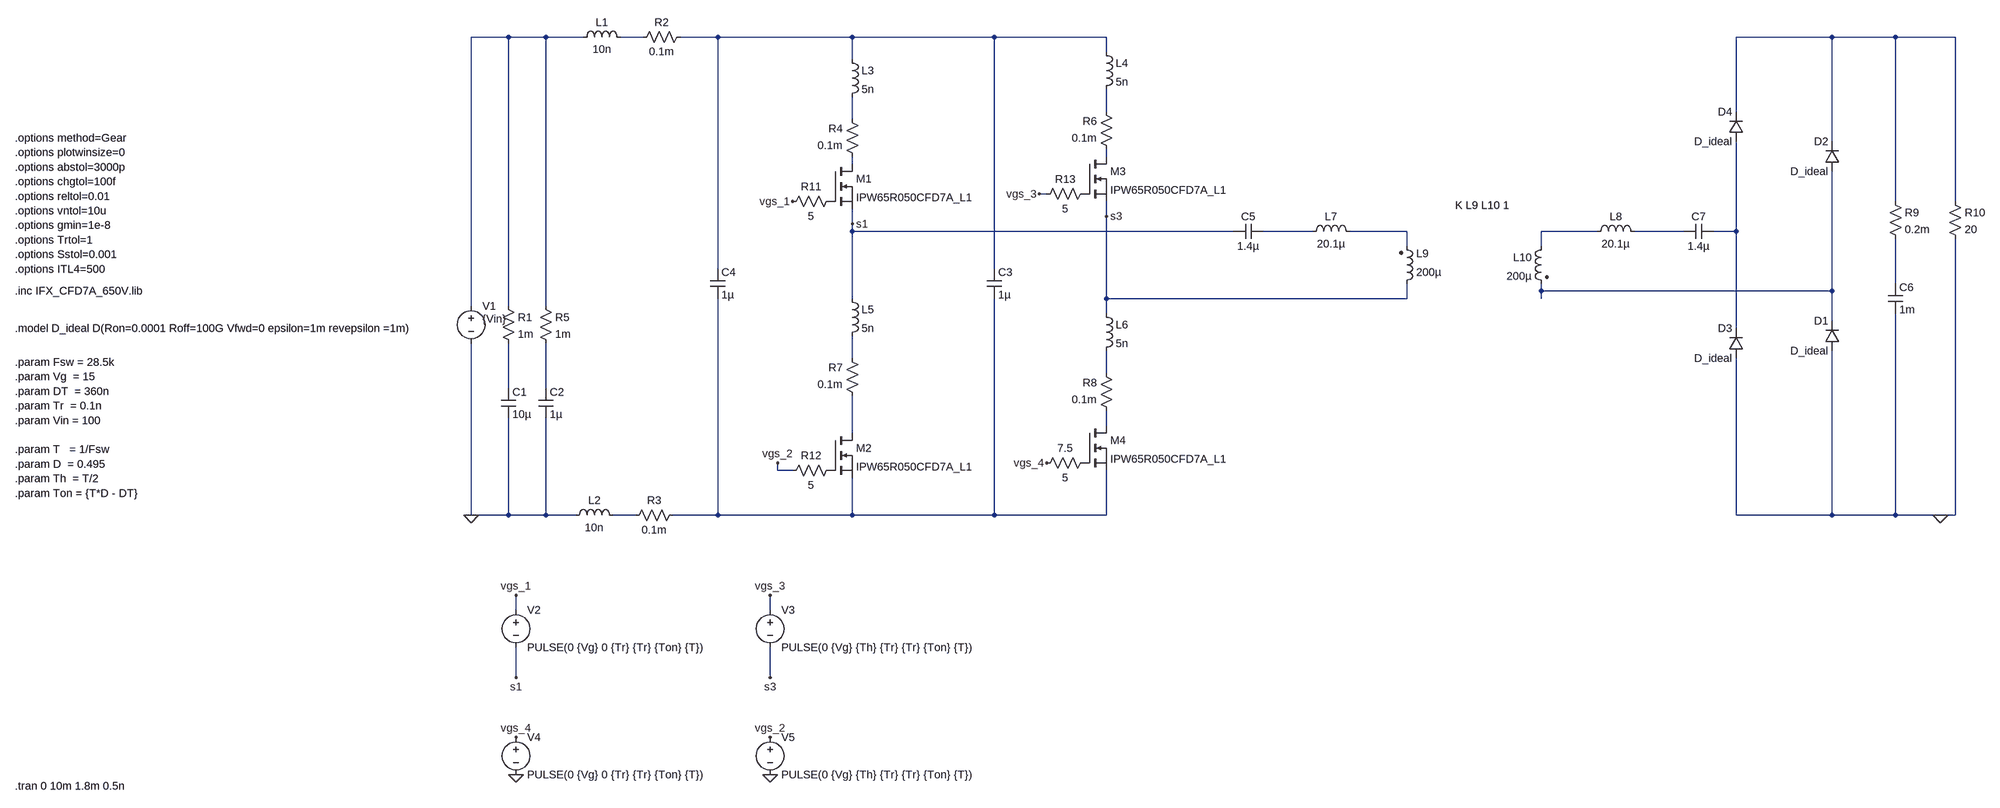
[diagram p0: schematic CLLC_v3.asc]
CLLC_v3.asc, the LTspice schematic file:
Version 4.1
SHEET 1 3956 1640
WIRE 464 -16 384 -16
WIRE 544 -16 464 -16
WIRE 624 -16 544 -16
WIRE 752 -16 704 -16
WIRE 912 -16 832 -16
WIRE 1200 -16 912 -16
WIRE 1504 -16 1200 -16
WIRE 1744 -16 1504 -16
WIRE 3456 -16 3152 -16
WIRE 3760 -16 3456 -16
WIRE 3888 -16 3760 -16
WIRE 1744 16 1744 -16
WIRE 1200 32 1200 -16
WIRE 1744 144 1744 96
WIRE 3152 144 3152 -16
WIRE 1200 160 1200 112
WIRE 3456 208 3456 -16
WIRE 1744 240 1744 224
WIRE 1200 256 1200 240
WIRE 1616 320 1600 320
WIRE 3760 336 3760 -16
WIRE 3888 336 3888 -16
WIRE 1744 368 1744 336
WIRE 1200 384 1200 352
WIRE 1200 400 1200 384
WIRE 2016 400 1200 400
WIRE 2192 400 2080 400
WIRE 2432 400 2272 400
WIRE 2848 400 2720 400
WIRE 3040 400 2928 400
WIRE 3152 400 3152 208
WIRE 3152 400 3104 400
WIRE 2432 432 2432 400
WIRE 2720 432 2720 400
WIRE 912 480 912 -16
WIRE 1504 480 1504 -16
WIRE 3760 512 3760 416
WIRE 2720 528 2720 512
WIRE 3456 528 3456 272
WIRE 3456 528 2720 528
WIRE 1200 544 1200 400
WIRE 1744 544 1744 368
WIRE 2432 544 2432 512
WIRE 2432 544 1744 544
WIRE 2720 544 2720 528
WIRE 384 560 384 -16
WIRE 464 560 464 -16
WIRE 544 560 544 -16
WIRE 1744 576 1744 544
WIRE 3456 592 3456 528
WIRE 3152 608 3152 400
WIRE 1200 672 1200 624
WIRE 1744 704 1744 656
WIRE 464 736 464 640
WIRE 544 736 544 640
WIRE 1744 816 1744 784
WIRE 1200 832 1200 752
WIRE 1040 912 1040 896
WIRE 1072 912 1040 912
WIRE 384 1008 384 640
WIRE 464 1008 464 800
WIRE 464 1008 384 1008
WIRE 544 1008 544 800
WIRE 544 1008 464 1008
WIRE 608 1008 544 1008
WIRE 736 1008 688 1008
WIRE 912 1008 912 544
WIRE 912 1008 816 1008
WIRE 1200 1008 1200 928
WIRE 1200 1008 912 1008
WIRE 1504 1008 1504 544
WIRE 1504 1008 1200 1008
WIRE 1744 1008 1744 912
WIRE 1744 1008 1504 1008
WIRE 3152 1008 3152 672
WIRE 3456 1008 3456 656
WIRE 3456 1008 3152 1008
WIRE 3760 1008 3760 576
WIRE 3760 1008 3456 1008
WIRE 3856 1008 3760 1008
WIRE 3888 1008 3888 416
WIRE 3888 1008 3856 1008
WIRE 480 1248 480 1216
WIRE 1024 1248 1024 1216
WIRE 480 1392 480 1328
WIRE 1024 1392 1024 1328
FLAG 384 1008 0
FLAG 480 1216 vgs_1
FLAG 1072 336 vgs_1
FLAG 1616 896 vgs_4
FLAG 1024 1216 vgs_3
FLAG 1040 896 vgs_2
FLAG 1600 320 vgs_3
FLAG 3856 1008 0
FLAG 1200 384 s1
FLAG 1744 368 s3
FLAG 480 1392 s1
FLAG 1024 1392 s3
FLAG 480 1520 vgs_4
FLAG 1024 1520 vgs_2
FLAG 480 1600 0
FLAG 1024 1600 0
SYMBOL voltage 384 544 R0
WINDOW 3 24 44 Left 2
WINDOW 123 0 0 Left 0
WINDOW 39 0 0 Left 0
SYMATTR Value {Vin}
SYMATTR InstName V1
SYMBOL res 448 544 R0
SYMATTR InstName R1
SYMATTR Value 1m
SYMBOL cap 448 736 R0
SYMATTR InstName C1
SYMATTR Value 10µ
SYMBOL ind 608 0 R270
WINDOW 0 32 56 VTop 2
WINDOW 3 5 56 VBottom 2
SYMATTR InstName L1
SYMATTR Value 10n
SYMBOL res 848 -32 R90
WINDOW 0 0 56 VBottom 2
WINDOW 3 32 56 VTop 2
SYMATTR InstName R2
SYMATTR Value 0.1m
SYMBOL ind 592 1024 R270
WINDOW 0 32 56 VTop 2
WINDOW 3 5 56 VBottom 2
SYMATTR InstName L2
SYMATTR Value 10n
SYMBOL res 832 992 R90
WINDOW 0 0 56 VBottom 2
WINDOW 3 32 56 VTop 2
SYMATTR InstName R3
SYMATTR Value 0.1m
SYMBOL res 528 544 R0
SYMATTR InstName R5
SYMATTR Value 1m
SYMBOL cap 528 736 R0
SYMATTR InstName C2
SYMATTR Value 1µ
SYMBOL cap 1488 480 R0
SYMATTR InstName C3
SYMATTR Value 1µ
SYMBOL cap 896 480 R0
SYMATTR InstName C4
SYMATTR Value 1µ
SYMBOL cap 2080 384 R90
WINDOW 0 0 32 VBottom 2
WINDOW 3 32 32 VTop 2
SYMATTR InstName C5
SYMATTR Value 1.4µ
SYMBOL ind 2176 416 R270
WINDOW 0 32 56 VTop 2
WINDOW 3 5 56 VBottom 2
SYMATTR InstName L7
SYMATTR Value 20.1µ
SYMBOL diode 3472 656 R180
WINDOW 0 24 64 Left 2
WINDOW 3 24 0 Left 2
SYMATTR InstName D1
SYMATTR Value D_ideal
SYMBOL diode 3472 272 R180
WINDOW 0 24 64 Left 2
WINDOW 3 24 0 Left 2
SYMATTR InstName D2
SYMATTR Value D_ideal
SYMBOL diode 3168 672 R180
WINDOW 0 24 64 Left 2
WINDOW 3 24 0 Left 2
SYMATTR InstName D3
SYMATTR Value D_ideal
SYMBOL diode 3168 208 R180
WINDOW 0 24 64 Left 2
WINDOW 3 24 0 Left 2
SYMATTR InstName D4
SYMATTR Value D_ideal
SYMBOL res 3744 320 R0
SYMATTR InstName R9
SYMATTR Value 0.2m
SYMBOL cap 3744 512 R0
SYMATTR InstName C6
SYMATTR Value 1m
SYMBOL res 3872 320 R0
SYMATTR InstName R10
SYMATTR Value 20
SYMBOL cap 3040 416 R270
WINDOW 0 32 32 VTop 2
WINDOW 3 0 32 VBottom 2
SYMATTR InstName C7
SYMATTR Value 1.4µ
SYMBOL ind 2832 416 R270
WINDOW 0 32 56 VTop 2
WINDOW 3 5 56 VBottom 2
SYMATTR InstName L8
SYMATTR Value 20.1µ
SYMBOL voltage 480 1232 R0
WINDOW 123 0 0 Left 0
WINDOW 39 0 0 Left 0
SYMATTR InstName V2
SYMATTR Value PULSE(0 {Vg} 0 {Tr} {Tr} {Ton} {T})
SYMBOL voltage 1024 1232 R0
WINDOW 123 0 0 Left 0
WINDOW 39 0 0 Left 0
SYMATTR InstName V3
SYMATTR Value PULSE(0 {Vg} {Th} {Tr} {Tr} {Ton} {T})
SYMBOL res 1168 320 R90
WINDOW 0 0 56 VBottom 2
WINDOW 3 32 56 VTop 2
SYMATTR InstName R11
SYMATTR Value 5
SYMBOL res 1168 896 R90
WINDOW 0 0 56 VBottom 2
WINDOW 3 32 56 VTop 2
SYMATTR InstName R12
SYMATTR Value 5
SYMBOL res 1712 304 R90
WINDOW 0 0 56 VBottom 2
WINDOW 3 32 56 VTop 2
SYMATTR InstName R13
SYMATTR Value 5
SYMBOL res 1712 880 R90
WINDOW 0 0 56 VBottom 2
WINDOW 3 32 56 VTop 2
SYMATTR InstName 7.5
SYMATTR Value 5
SYMBOL nmos 1152 256 R0
SYMATTR InstName M1
SYMATTR Value IPW65R050CFD7A_L1
SYMATTR Prefix X
SYMBOL nmos 1152 832 R0
SYMATTR InstName M2
SYMATTR Value IPW65R050CFD7A_L1
SYMATTR Prefix X
SYMBOL nmos 1696 240 R0
SYMATTR InstName M3
SYMATTR Value IPW65R050CFD7A_L1
SYMATTR Prefix X
SYMBOL nmos 1696 816 R0
SYMATTR InstName M4
SYMATTR Value IPW65R050CFD7A_L1
SYMATTR Prefix X
SYMBOL ind2 2416 528 M180
WINDOW 0 36 80 Left 2
WINDOW 3 36 40 Left 2
SYMATTR InstName L9
SYMATTR Value 200µ
SYMBOL ind2 2736 416 M0
SYMATTR InstName L10
SYMATTR Value 200µ
SYMBOL voltage 480 1504 R0
WINDOW 123 0 0 Left 0
WINDOW 39 0 0 Left 0
SYMATTR InstName V4
SYMATTR Value PULSE(0 {Vg} 0 {Tr} {Tr} {Ton} {T})
SYMBOL voltage 1024 1504 R0
WINDOW 123 0 0 Left 0
WINDOW 39 0 0 Left 0
SYMATTR InstName V5
SYMATTR Value PULSE(0 {Vg} {Th} {Tr} {Tr} {Ton} {T})
SYMBOL ind 1184 16 R0
SYMATTR InstName L3
SYMATTR Value 5n
SYMBOL res 1216 256 R180
WINDOW 0 36 76 Left 2
WINDOW 3 36 40 Left 2
SYMATTR InstName R4
SYMATTR Value 0.1m
SYMBOL ind 1728 0 R0
SYMATTR InstName L4
SYMATTR Value 5n
SYMBOL res 1760 240 R180
WINDOW 0 36 76 Left 2
WINDOW 3 36 40 Left 2
SYMATTR InstName R6
SYMATTR Value 0.1m
SYMBOL ind 1184 528 R0
SYMATTR InstName L5
SYMATTR Value 5n
SYMBOL res 1216 768 R180
WINDOW 0 36 76 Left 2
WINDOW 3 36 40 Left 2
SYMATTR InstName R7
SYMATTR Value 0.1m
SYMBOL ind 1728 560 R0
SYMATTR InstName L6
SYMATTR Value 5n
SYMBOL res 1760 800 R180
WINDOW 0 36 76 Left 2
WINDOW 3 36 40 Left 2
SYMATTR InstName R8
SYMATTR Value 0.1m
TEXT -856 200 Left 2 !.options method=Gear\n.options plotwinsize=0\n.options abstol=3000p\n.options chgtol=100f\n.options reltol=0.01\n.options vntol=10u\n.options gmin=1e-8\n.options Trtol=1\n.options Sstol=0.001\n.options ITL4=500
TEXT -856 528 Left 2 !.inc IFX_CFD7A_650V.lib
TEXT -856 608 Left 2 !.model D_ideal D(Ron=0.0001 Roff=100G Vfwd=0 epsilon=1m revepsilon =1m)
TEXT -856 680 Left 2 !.param Fsw = 28.5k\n.param Vg  = 15\n.param DT  = 360n\n.param Tr  = 0.1n    \n.param Vin = 100\n \n.param T   = 1/Fsw\n.param D  = 0.495         \n.param Th  = T/2           \n.param Ton = {T*D - DT}
TEXT 2536 344 Left 2 !K L9 L10 1
TEXT -856 1624 Left 2 !.tran 0 10m 1.8m 0.5n

The netlist it stands for:
* CLLC_v3.asc
V1 N001 0 {Vin}
R1 N001 N018 1m
C1 N018 0 10µ
L1 N001 N002 10n
R2 N003 N002 0.1m
L2 0 N022 10n
R3 N023 N022 0.1m
R5 N001 N019 1m
C2 N019 0 1µ
C3 N003 N023 1µ
C4 N003 N023 1µ
C5 N009 s1 1.4µ
L7 N009 N010 20.1µ
D1 0 N015 D_ideal
D2 N015 N004 D_ideal
D3 0 N013 D_ideal
D4 N013 N004 D_ideal
R9 N004 N014 0.2m
C6 N014 0 1m
R10 N004 0 20
C7 N012 N013 1.4µ
L8 N011 N012 20.1µ
V2 vgs_1 s1 PULSE(0 {Vg} 0 {Tr} {Tr} {Ton} {T})
V3 vgs_3 s3 PULSE(0 {Vg} {Th} {Tr} {Tr} {Ton} {T})
R11 P001 vgs_1 5
R12 P002 vgs_2 5
R13 P003 vgs_3 5
R§7.5 P004 vgs_4 5
X§M1 N008 P001 s1 IPW65R050CFD7A_L1  ; pins D G S
X§M2 N021 P002 N023 IPW65R050CFD7A_L1  ; pins D G S
X§M3 N007 P003 s3 IPW65R050CFD7A_L1  ; pins D G S
X§M4 N020 P004 N023 IPW65R050CFD7A_L1  ; pins D G S
L9 s3 N010 200µ
L10 N011 N015 200µ
V4 vgs_4 0 PULSE(0 {Vg} 0 {Tr} {Tr} {Ton} {T})
V5 vgs_2 0 PULSE(0 {Vg} {Th} {Tr} {Tr} {Ton} {T})
L3 N003 N006 5n
R4 N008 N006 0.1m
L4 N003 N005 5n
R6 N007 N005 0.1m
L5 s1 N016 5n
R7 N021 N016 0.1m
L6 s3 N017 5n
R8 N020 N017 0.1m
.model D D
.lib standard.dio
.options method=Gear
.options plotwinsize=0
.options abstol=3000p
.options chgtol=100f
.options reltol=0.01
.options vntol=10u
.options gmin=1e-8
.options Trtol=1
.options Sstol=0.001
.options ITL4=500
.inc IFX_CFD7A_650V.lib
.model D_ideal D(Ron=0.0001 Roff=100G Vfwd=0 epsilon=1m revepsilon =1m)
.param Fsw = 28.5k
.param Vg  = 15
.param DT  = 360n
.param Tr  = 0.1n
.param Vin = 100
.param T   = 1/Fsw
.param D  = 0.495
.param Th  = T/2
.param Ton = {T*D - DT}
K L9 L10 1
.tran 0 10m 1.8m 0.5n
.backanno
.end